# Altium schematic sheet NanoD1_Audio.SchDoc
size 420 x 297 mm; SheetNumber: 5; SheetTotal: 8
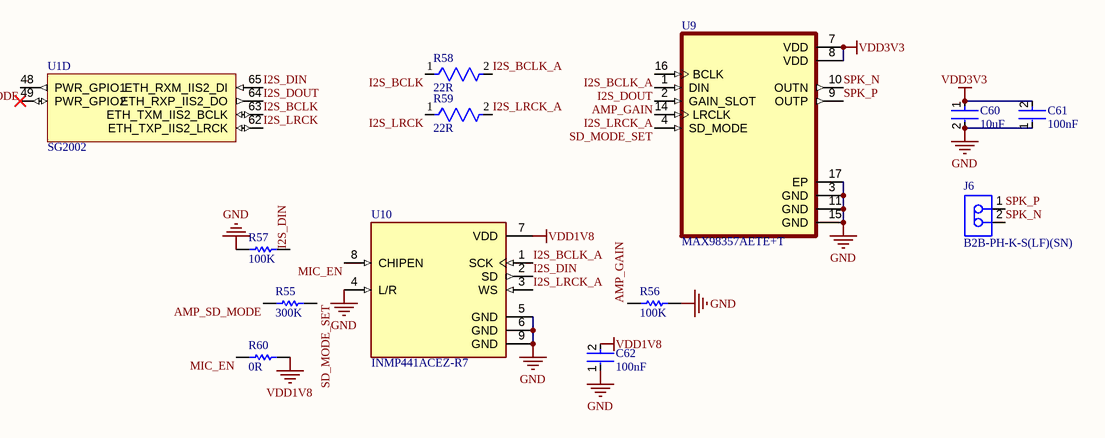
[diagram p0: NanoD1_Audio.SchDoc]

## Parts
C60  10uF  [FP-GRM188-0_15-IPC_B]
C61  100nF  [FP-GRM15-MFG]
C62  100nF  [FP-GRM15-MFG]
J6  B2B-PH-K-S(LF)(SN)  [JST-B2B-PH-K-S_V]
R55  300K  [RESC1005X40X25ML05T10]
R56  100K  [RESC1005X40X25ML05T10]
R57  100K  [RESC1005X40X25ML05T10]
R58  22R  [FP-RC0402-0_4-IPC_A]
R59  22R  [FP-RC0402-0_4-IPC_A]
R60  0R  [RESC1005X40X25ML05T10]
U1  SG2002  [QFN88-9x9-0.35]  (part D of 7)
U9  MAX98357AETE+T  [QFN50P300X300X80-17N]
U10  INMP441ACEZ-R7  [MIC_INMP441ACEZ-R7]

## Nets
GND: C60.2 C61.1 C62.1 R56.2 R57.1 U9.3(GND) U9.11(GND) U9.15(GND) U9.17(EP) U10.4(L/R) U10.5(GND) U10.6(GND) U10.9(GND)
VDD1V8: C62.2 R60.2 U10.7(VDD)
VDD3V3: C60.1 C61.2 U9.7(VDD) U9.8(VDD)
AMP_GAIN: R56.1 U9.2(GAIN_SLOT)
AMP_SD_MODE: R55.1 U1.48(PWR_GPIO1)
I2S_BCLK: R58.1 U1.63(ETH_TXM_IIS2_BCLK)
I2S_BCLK_A: R58.2 U9.16(BCLK) U10.1(SCK)
I2S_DIN: R57.2 U1.65(ETH_RXM_IIS2_DI) U10.2(SD)
I2S_DOUT: U1.64(ETH_RXP_IIS2_DO) U9.1(DIN)
I2S_LRCK: R59.1 U1.62(ETH_TXP_IIS2_LRCK)
I2S_LRCK_A: R59.2 U9.14(LRCLK) U10.3(WS)
MIC_EN: R60.1 U10.8(CHIPEN)
SD_MODE_SET: R55.2 U9.4(SD_MODE)
SPK_N: J6.2 U9.10(OUTN)
SPK_P: J6.1 U9.9(OUTP)

Not connected (* = marked no-connect by the designer): U1 49(PWR_GPIO2)*

## Notes on the sheet
- THIS DOCUMENT AND THE DATA DISCLOSED HEREIN OR
- HEREWITH IS THE PROPERTY OF ALTIUM LIMITED AND MAY
- DWG NO:
- REVISION
- REV:
- DESCRIPTION
- DATE
- APPROVED
- BE FREELY DISTRIBUTED IN WHOLE. NO RIGHTS ARE
- RESERVED OR EXPRESS OR IMPLIED WARANTEE GIVEN.
- ENG:
- APPROVALS
- PROJECT
- DSN:
- CHK:
- REFERENCE DOCUMENTS
- PROJECT REVISION:
- TITLE
- DOCUMENT REVISION:
- DESIGN ITEM:
- BOM:
- FAB DWG:
- PCB DWG:
- ASSY DWG:
- SCALE:
- A3
- SIZE
- CAGE CODE
- FILE NAME
- DWG NO.
- SHEET
- OF
- REV

## Library data of the parts
C60 = CMP-06035-003612-1: Chip Multilayer Ceramic Capacitors for General Purpose, 0603, 10uF, X5R, 15%, 20%, 10V; Tolerance: 20%; Dielectric: X5R; Package Quantity: 4000; Width: 0.8mm; Case/Package: 0603; Thickness: 0.035inch; Capacitance: 10uF; Voltage Rating: 10V; Voltage Rating (DC): 10V; Termination: SMD/SMT; Length: 1.6mm; Lead Free: Lead Free; Mount: Surface Mount; Height: 0.8mm; Depth: 0.8mm; Packaging: Tape and Reel; Weight: 0.000222oz; Min Operating Temperature: -55°C; Case Code (Metric): 1608; Max Operating Temperature: 85°C; Case Code (Imperial): 0603; Material: Ceramic
C61 C62 = CMP-2100-03641-2: CAP CER 0.1UF 16V X7R 0402; Manufacturer Part Number: GRM155R71C104KA88D; Manufacturer: Murata; Standoff Height: 0mm; Tolerance: 10%; Voltage Rating: 16Vdc; Material: Ceramic; Capacitance: 0.10μF; Value: 0.10μF; RoHS: TRUE; Temperature Characteristic: X7R; Octopart: https://octopart.com/grm155r71c104ka88d-murata-196880; Digikey Description: CAP CER 0.1UF 16V X7R 0402; Device Class L3: Ceramic Capacitors; Height: 0.55mm; ComponentLink2Description: Datasheet; Temperature Range Low: -55°C; Ipc Land Pattern Name: CAPC10050X219; ComponentLink2URL: https://search.murata.co.jp/Ceramy/image/img/A01X/G101/ENG/GRM155R71H471KA01-01A.pdf; Device Class L1: Passive Components; Lead Free: yes; Category: Cap; Package: GRM15; Temperature: -55°C to +125°C; Device Class L2: Capacitors; Temperature Range High: +125°C; Mouser Description: 0402 0.1 uF 16V ±10 % Tolerance X7R SMT Multilayer Ceramic Capacitor
J6 = CMP-2000-05162-1: Male Header, Pitch 2 mm, 1 x 2 Position, Height 6 mm, Tail Length 3.4 mm, -25 to 85 degC, RoHS, Bulk; Manufacturer: JST; Pitch: 2mm; Style/Orientation: StraightHeader/Plug; No of Positions: 2; Datasheet Version: Nov-08; Datasheet URL: http://datasheet.octopart.com/B2B-PH-K-S%28LF%29%28SN%29-JST-datasheet-8324864.pdf; Manufacturer URL: http://www.jst.com/home2.html; Type: ShroudedHeader; Termination: Crimp
R55 = CMP-2002-07008-1: Manufacturer: Yageo / Phycomp; Part Number: RC0402FR-07300KL
R56 R57 = CMP-2002-07343-1: Part Number: RC0402FR-07100KL; Manufacturer: Yageo / Phycomp
R58 R59 = CMP-2002-07520-2: Tolerance: 1%; Power Rating: 63mW; Voltage Rating: 50V; Temperature Coefficient: 100ppm/°C; Resistance: 22Ω; Termination: SMD/SMT; Depth: 500µm; Packaging: Tape & Reel; Height: 400µm; Width: 500µm; Case Code (Imperial): 0402; Length: 1mm; Schedule B: 8533210045, 8533210045|8533210045|8533210045|8533210045|8533210045|8533210045|8533210045|8533210045, 8533210045|8533210045|8533210045|8533210045|8533210045|8533210045|8533210045|8533210045|8533210045, 8533210045|8533210045|8533210045|8533210045|8533210045|8533210045|8533210045|8533210045|8533210045|8533210045; Case/Package: 0402; Max Operating Temperature: 155°C; Min Operating Temperature: -55°C; REACH SVHC: Unknown; RoHS: Compliant; Military Standard: Not; Voltage Rating (DC): 50V; Lead Free: Lead Free; Voltage Rating (AC): 50V; Number of Pins: 2; Composition: Thick Film
R60 = CMP-1011-00001-2: Manufacturer: Yageo / Phycomp; Part Number: RC0402JR-070RL
U1 = SG2002: RISC-V C906 / Cortex-A53 SoC, 256MB DDR3 SiP, QFN88 9x9 0.35mm
U9 = MAX98357AETE+T: Tiny, Low-Cost, PCM Class D Amplifier with Class AB Performance; MF: Analog Devices; SnapEDA_Link: https://www.snapeda.com/parts/MAX98357AETE+T/Analog+Devices/view-part/?ref=snap; Package: TQFN-16 Maxim; Value: *; MP: MAX98357AETE+T; Check_prices: https://www.snapeda.com/parts/MAX98357AETE+T/Analog+Devices/view-part/?ref=eda
U10 = INMP441ACEZ-R7: 60 Hz ~ 15 kHz Digital, I2S Microphone MEMS (Silicon) 1.62 V ~ 3.63 V Omnidirectional (-26dB Â±3dB @ 94dB SPL) Solder Pads; MF: TDK InvenSense; SnapEDA_Link: https://www.snapeda.com/parts/INMP441ACEZ-R7/TDK/view-part/?ref=snap; Package: LGA-9 TDK InvenSense; Value: *; MP: INMP441ACEZ-R7; Check_prices: https://www.snapeda.com/parts/INMP441ACEZ-R7/TDK/view-part/?ref=eda